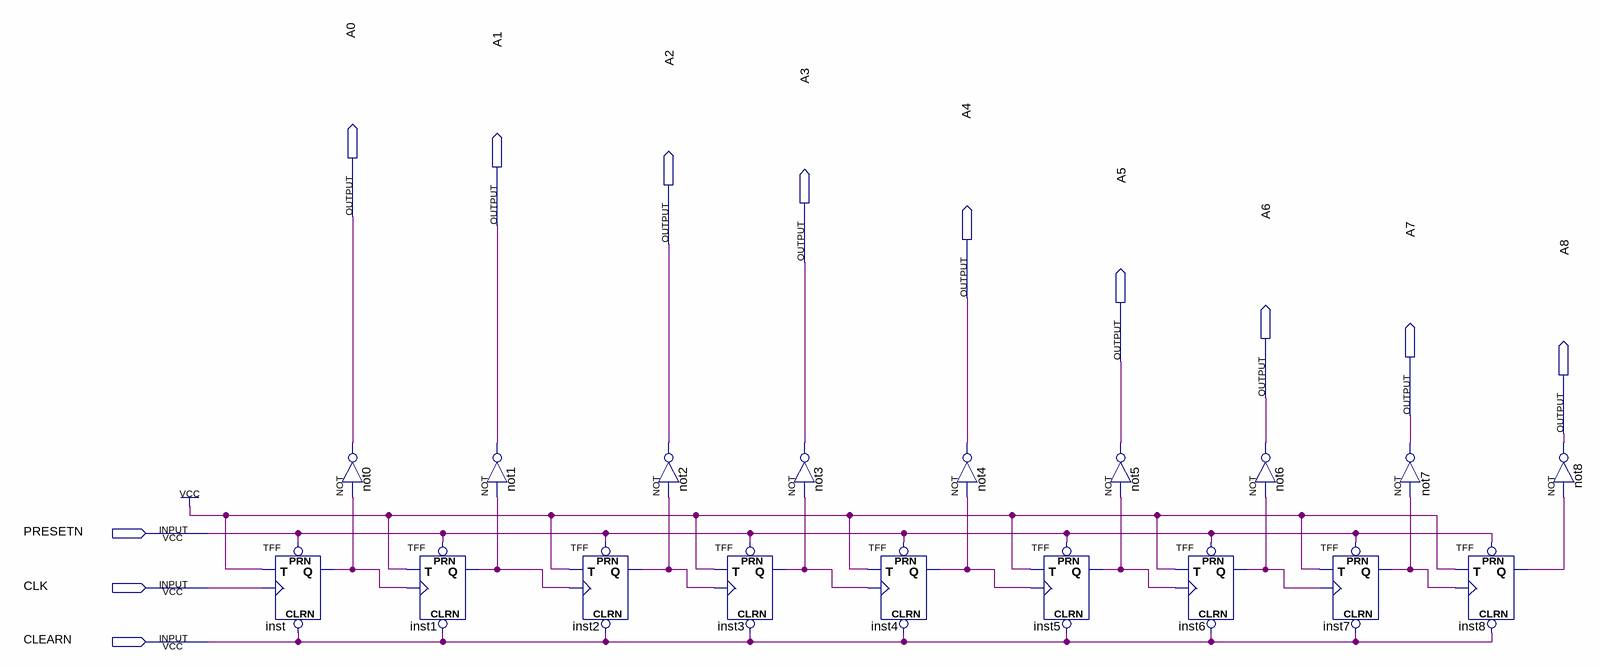
[diagram p0: schematic sheet]
// Quartus schematic Count512.bdf as structural Verilog: 18 symbols, 12 pins
module Count512 (
  input  PRESETN,
  input  CLK,
  input  CLEARN,
  output A0,
  output A1,
  output A2,
  output A3,
  output A4,
  output A5,
  output A6,
  output A7,
  output A8
);

  wire inst1_q, inst2_q, inst3_q, inst4_q, inst5_q, inst6_q, inst7_q, inst8_q, inst_q;

  TFF inst (.PRN(PRESETN), .CLRN(CLEARN), .T(1'b1), .CLK(CLK), .Q(inst_q));
  not not0 (A0, inst_q);
  TFF inst1 (.PRN(PRESETN), .CLRN(CLEARN), .T(1'b1), .CLK(inst_q), .Q(inst1_q));
  not not1 (A1, inst1_q);
  TFF inst2 (.PRN(PRESETN), .CLRN(CLEARN), .T(1'b1), .CLK(inst1_q), .Q(inst2_q));
  not not2 (A2, inst2_q);
  TFF inst3 (.PRN(PRESETN), .CLRN(CLEARN), .T(1'b1), .CLK(inst2_q), .Q(inst3_q));
  not not3 (A3, inst3_q);
  TFF inst4 (.PRN(PRESETN), .CLRN(CLEARN), .T(1'b1), .CLK(inst3_q), .Q(inst4_q));
  not not4 (A4, inst4_q);
  TFF inst5 (.PRN(PRESETN), .CLRN(CLEARN), .T(1'b1), .CLK(inst4_q), .Q(inst5_q));
  not not5 (A5, inst5_q);
  TFF inst6 (.PRN(PRESETN), .CLRN(CLEARN), .T(1'b1), .CLK(inst5_q), .Q(inst6_q));
  not not6 (A6, inst6_q);
  TFF inst7 (.PRN(PRESETN), .CLRN(CLEARN), .T(1'b1), .CLK(inst6_q), .Q(inst7_q));
  not not7 (A7, inst7_q);
  TFF inst8 (.PRN(PRESETN), .CLRN(CLEARN), .T(1'b1), .CLK(inst7_q), .Q(inst8_q));
  not not8 (A8, inst8_q);
endmodule
